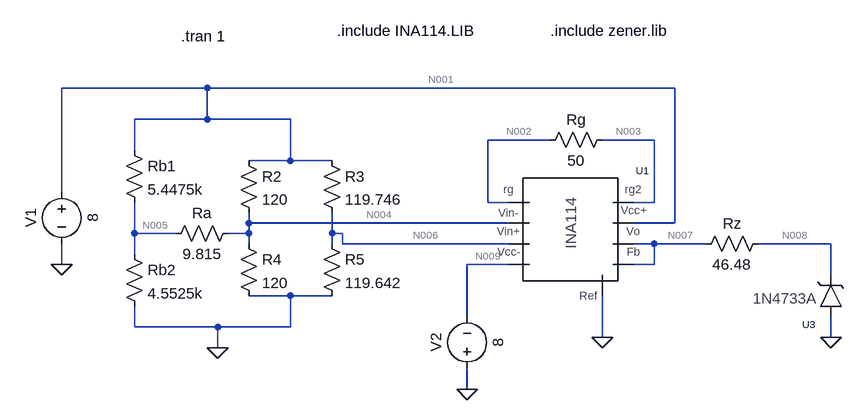
[diagram p0: schematic dinamometro_ltspice.asc]
dinamometro_ltspice.asc, the LTspice schematic file:
Version 4.1
SHEET 1 880 680
WIRE -336 -96 -560 -96
WIRE 384 -96 -336 -96
WIRE -336 -48 -336 -96
WIRE -336 -48 -448 -48
WIRE -208 -48 -336 -48
WIRE 192 -16 96 -16
WIRE 352 -16 272 -16
WIRE -448 0 -448 -48
WIRE -208 16 -208 -48
WIRE -208 16 -272 16
WIRE -144 16 -208 16
WIRE -560 64 -560 -96
WIRE 96 80 96 -16
WIRE 128 80 96 80
WIRE 352 80 352 -16
WIRE 352 80 320 80
WIRE -272 112 -272 96
WIRE 128 112 -272 112
WIRE 384 112 384 -96
WIRE 384 112 320 112
WIRE -448 128 -448 80
WIRE -384 128 -448 128
WIRE -272 128 -272 112
WIRE -272 128 -304 128
WIRE -144 128 -144 96
WIRE -128 128 -144 128
WIRE -272 144 -272 128
WIRE -144 144 -144 128
WIRE -128 144 -128 128
WIRE 128 144 -128 144
WIRE 352 144 320 144
WIRE 432 144 352 144
WIRE 624 144 512 144
WIRE -448 160 -448 128
WIRE -560 176 -560 144
WIRE 128 176 64 176
WIRE 352 176 352 144
WIRE 352 176 320 176
WIRE 624 192 624 144
WIRE -208 224 -272 224
WIRE -144 224 -208 224
WIRE 64 256 64 176
WIRE -448 272 -448 240
WIRE -320 272 -448 272
WIRE -208 272 -208 224
WIRE -208 272 -320 272
WIRE 272 288 272 224
WIRE 624 288 624 256
WIRE -320 304 -320 272
WIRE 64 368 64 336
FLAG 272 288 0
FLAG 624 288 0
FLAG -320 304 0
FLAG 64 368 0
FLAG -560 176 0
SYMBOL INA114 224 112 R0
SYMATTR InstName U1
SYMBOL res 288 -32 R90
WINDOW 0 0 56 VBottom 2
WINDOW 3 32 56 VTop 2
SYMATTR InstName Rg
SYMATTR Value 50
SYMATTR SpiceLine tol=1 pwr=0.1
SYMBOL res -288 0 R0
SYMATTR InstName R2
SYMATTR Value 120
SYMATTR SpiceLine tol=0 pwr=0.1
SYMBOL res -160 0 R0
SYMATTR InstName R3
SYMATTR Value 119.746
SYMATTR SpiceLine tol=0 pwr=0.1
SYMBOL res -288 128 R0
SYMATTR InstName R4
SYMATTR Value 120
SYMATTR SpiceLine tol=0 pwr=0.1
SYMBOL res -160 128 R0
SYMATTR InstName R5
SYMATTR Value 119.642
SYMATTR SpiceLine tol=0 pwr=0.1
SYMBOL res -288 112 R90
WINDOW 0 0 56 VBottom 2
WINDOW 3 32 56 VTop 2
SYMATTR InstName Ra
SYMATTR Value 9.815
SYMATTR SpiceLine tol=0 pwr=0.1
SYMBOL res -464 -16 R0
SYMATTR InstName Rb1
SYMATTR Value 5.4475k
SYMATTR SpiceLine tol=1 pwr=0.1
SYMBOL res -464 144 R0
SYMATTR InstName Rb2
SYMATTR Value 4.5525k
SYMATTR SpiceLine tol=1 pwr=0.1
SYMBOL res 528 128 R90
WINDOW 0 0 56 VBottom 2
WINDOW 3 32 56 VTop 2
SYMATTR InstName Rz
SYMATTR Value 46.48
SYMATTR SpiceLine tol=0 pwr=1
SYMBOL voltage -560 48 R0
WINDOW 0 -32 56 VBottom 2
WINDOW 3 32 56 VTop 2
WINDOW 123 0 0 Left 0
WINDOW 39 0 0 Left 0
SYMATTR InstName V1
SYMATTR Value 8
SYMBOL voltage 64 352 R180
WINDOW 0 32 56 VTop 2
WINDOW 3 -32 56 VBottom 2
WINDOW 123 0 0 Left 0
WINDOW 39 0 0 Left 0
SYMATTR InstName V2
SYMATTR Value 8
SYMBOL 1N4733A 624 224 R180
SYMATTR InstName U3
TEXT -376 -176 Left 2 !.tran 1
TEXT -136 -184 Left 2 !.include INA114.LIB
TEXT 192 -184 Left 2 !.include zener.lib

The netlist it stands for:
* dinamometro_ltspice.asc
X§U1 N006 N004 N001 N009 N007 N007 0 N002 N003 INA114  ; pins Vin+ Vin- Vcc+ Vcc- Vo Fb Ref rg rg2
Rg N003 N002 50 tol=1 pwr=0.1
R2 N001 N004 120 tol=0 pwr=0.1
R3 N001 N006 119.746 tol=0 pwr=0.1
R4 N004 0 120 tol=0 pwr=0.1
R5 N006 0 119.642 tol=0 pwr=0.1
Ra N004 N005 9.815 tol=0 pwr=0.1
Rb1 N001 N005 5.4475k tol=1 pwr=0.1
Rb2 N005 0 4.5525k tol=1 pwr=0.1
Rz N008 N007 46.48 tol=0 pwr=1
V1 N001 0 8
V2 0 N009 8
X§U3 0 N008 DI_1N4733A
.tran 1
.include INA114.LIB
.include zener.lib
.backanno
.end

* Results of the author's LTspice run, read from the files saved beside the schematic
* Operating Point, zero values left out:
*   V(n001) = 8 V
*   V(n002) = 3.992 V
*   V(n003) = 3.997 V
*   V(n004) = 3.992 V
*   V(n005) = 3.99 V
*   V(n006) = 3.998 V
*   V(n007) = 5.603 V
*   V(n008) = 5.018 V
*   V(n009) = -8 V
*   I(R2) = 33.4 mA
*   I(R3) = 33.42 mA
*   I(R4) = 33.26 mA
*   I(R5) = 33.42 mA
*   I(Ra) = 140.4 µA
*   I(Rb1) = 736.1 µA
*   I(Rb2) = 876.5 µA
*   I(Rg) = 115.1 µA
*   I(Rz) = -12.58 mA
*   I(V1) = -81.69 mA
*   I(V2) = -1.417 mA
*   Ix(u1:1) = 380 pA
*   Ix(u1:10) = -115.1 µA
*   Ix(u1:2) = 377.9 pA
*   Ix(u1:3) = 14.14 mA
*   Ix(u1:4) = -1.417 mA
*   Ix(u1:5) = -12.67 mA
*   Ix(u1:6) = 89.78 µA
*   Ix(u1:8) = -137.5 µA
*   Ix(u1:9) = 115.1 µA
*   Ix(u3:1) = -12.58 mA
*   Ix(u3:2) = 12.58 mA